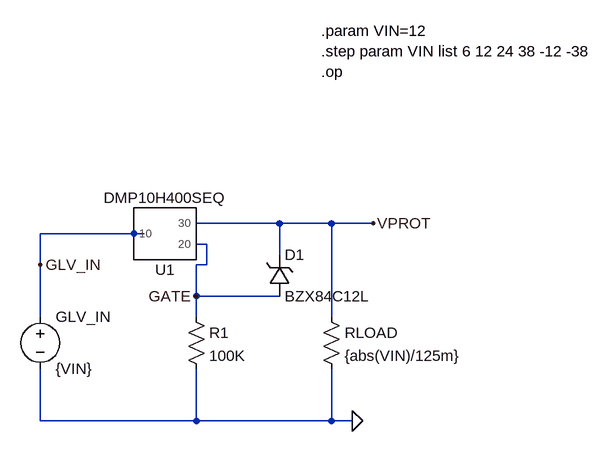
[diagram p0: schematic RPP.asc]
RPP.asc, the LTspice schematic file:
Version 4.1
SHEET 1 1036 680
WIRE 512 32 384 32
WIRE 592 32 512 32
WIRE 656 32 592 32
WIRE 288 48 144 48
WIRE 304 48 288 48
WIRE 400 64 384 64
WIRE 512 80 512 32
WIRE 144 96 144 48
WIRE 400 96 400 64
WIRE 400 96 384 96
WIRE 384 144 384 96
WIRE 512 144 384 144
WIRE 144 176 144 96
WIRE 384 176 384 144
WIRE 592 176 592 32
WIRE 144 336 144 256
WIRE 384 336 384 256
WIRE 384 336 144 336
WIRE 592 336 592 256
WIRE 592 336 384 336
WIRE 624 336 592 336
FLAG 624 336 0
FLAG 656 32 VPROT
FLAG 384 144 GATE
FLAG 144 96 GLV_IN
SYMBOL voltage 144 160 R0
WINDOW 123 0 0 Left 0
WINDOW 39 0 0 Left 0
SYMATTR InstName GLV_IN
SYMATTR Value {VIN}
SYMBOL res 368 160 R0
SYMATTR InstName R1
SYMATTR Value 100K
SYMBOL zener 496 144 M180
WINDOW 0 24 64 Left 2
WINDOW 3 24 0 Left 2
SYMATTR InstName D1
SYMATTR Value BZX84C12L
SYMBOL res 576 160 R0
SYMATTR InstName RLOAD
SYMATTR Value {abs(VIN)/125m}
SYMBOL DMP10H400SEQ 336 48 M180
SYMATTR InstName U1
TEXT 576 -264 Left 2 !.param VIN=12\n.step param VIN list 6 12 24 38 -12 -38\n.op

The netlist it stands for:
* RPP.asc
V§GLV_IN GLV_IN 0 {VIN}
R1 GATE 0 100K
D1 GATE VPROT BZX84C12L
RLOAD VPROT 0 {abs(VIN)/125m}
X§U1 GLV_IN GATE VPROT DMP10H400SEQ  ; pins 10 20 30
.model D D
.lib standard.dio
.param VIN=12
.step param VIN list 6 12 24 38 -12 -38
.op
.lib DMP10H400SEQ.lib
.backanno
.end